# EasyEDA Pro project elisaday-high-color-value-low-cost-reflow-24a201e4.epro, board 电源板-无0402
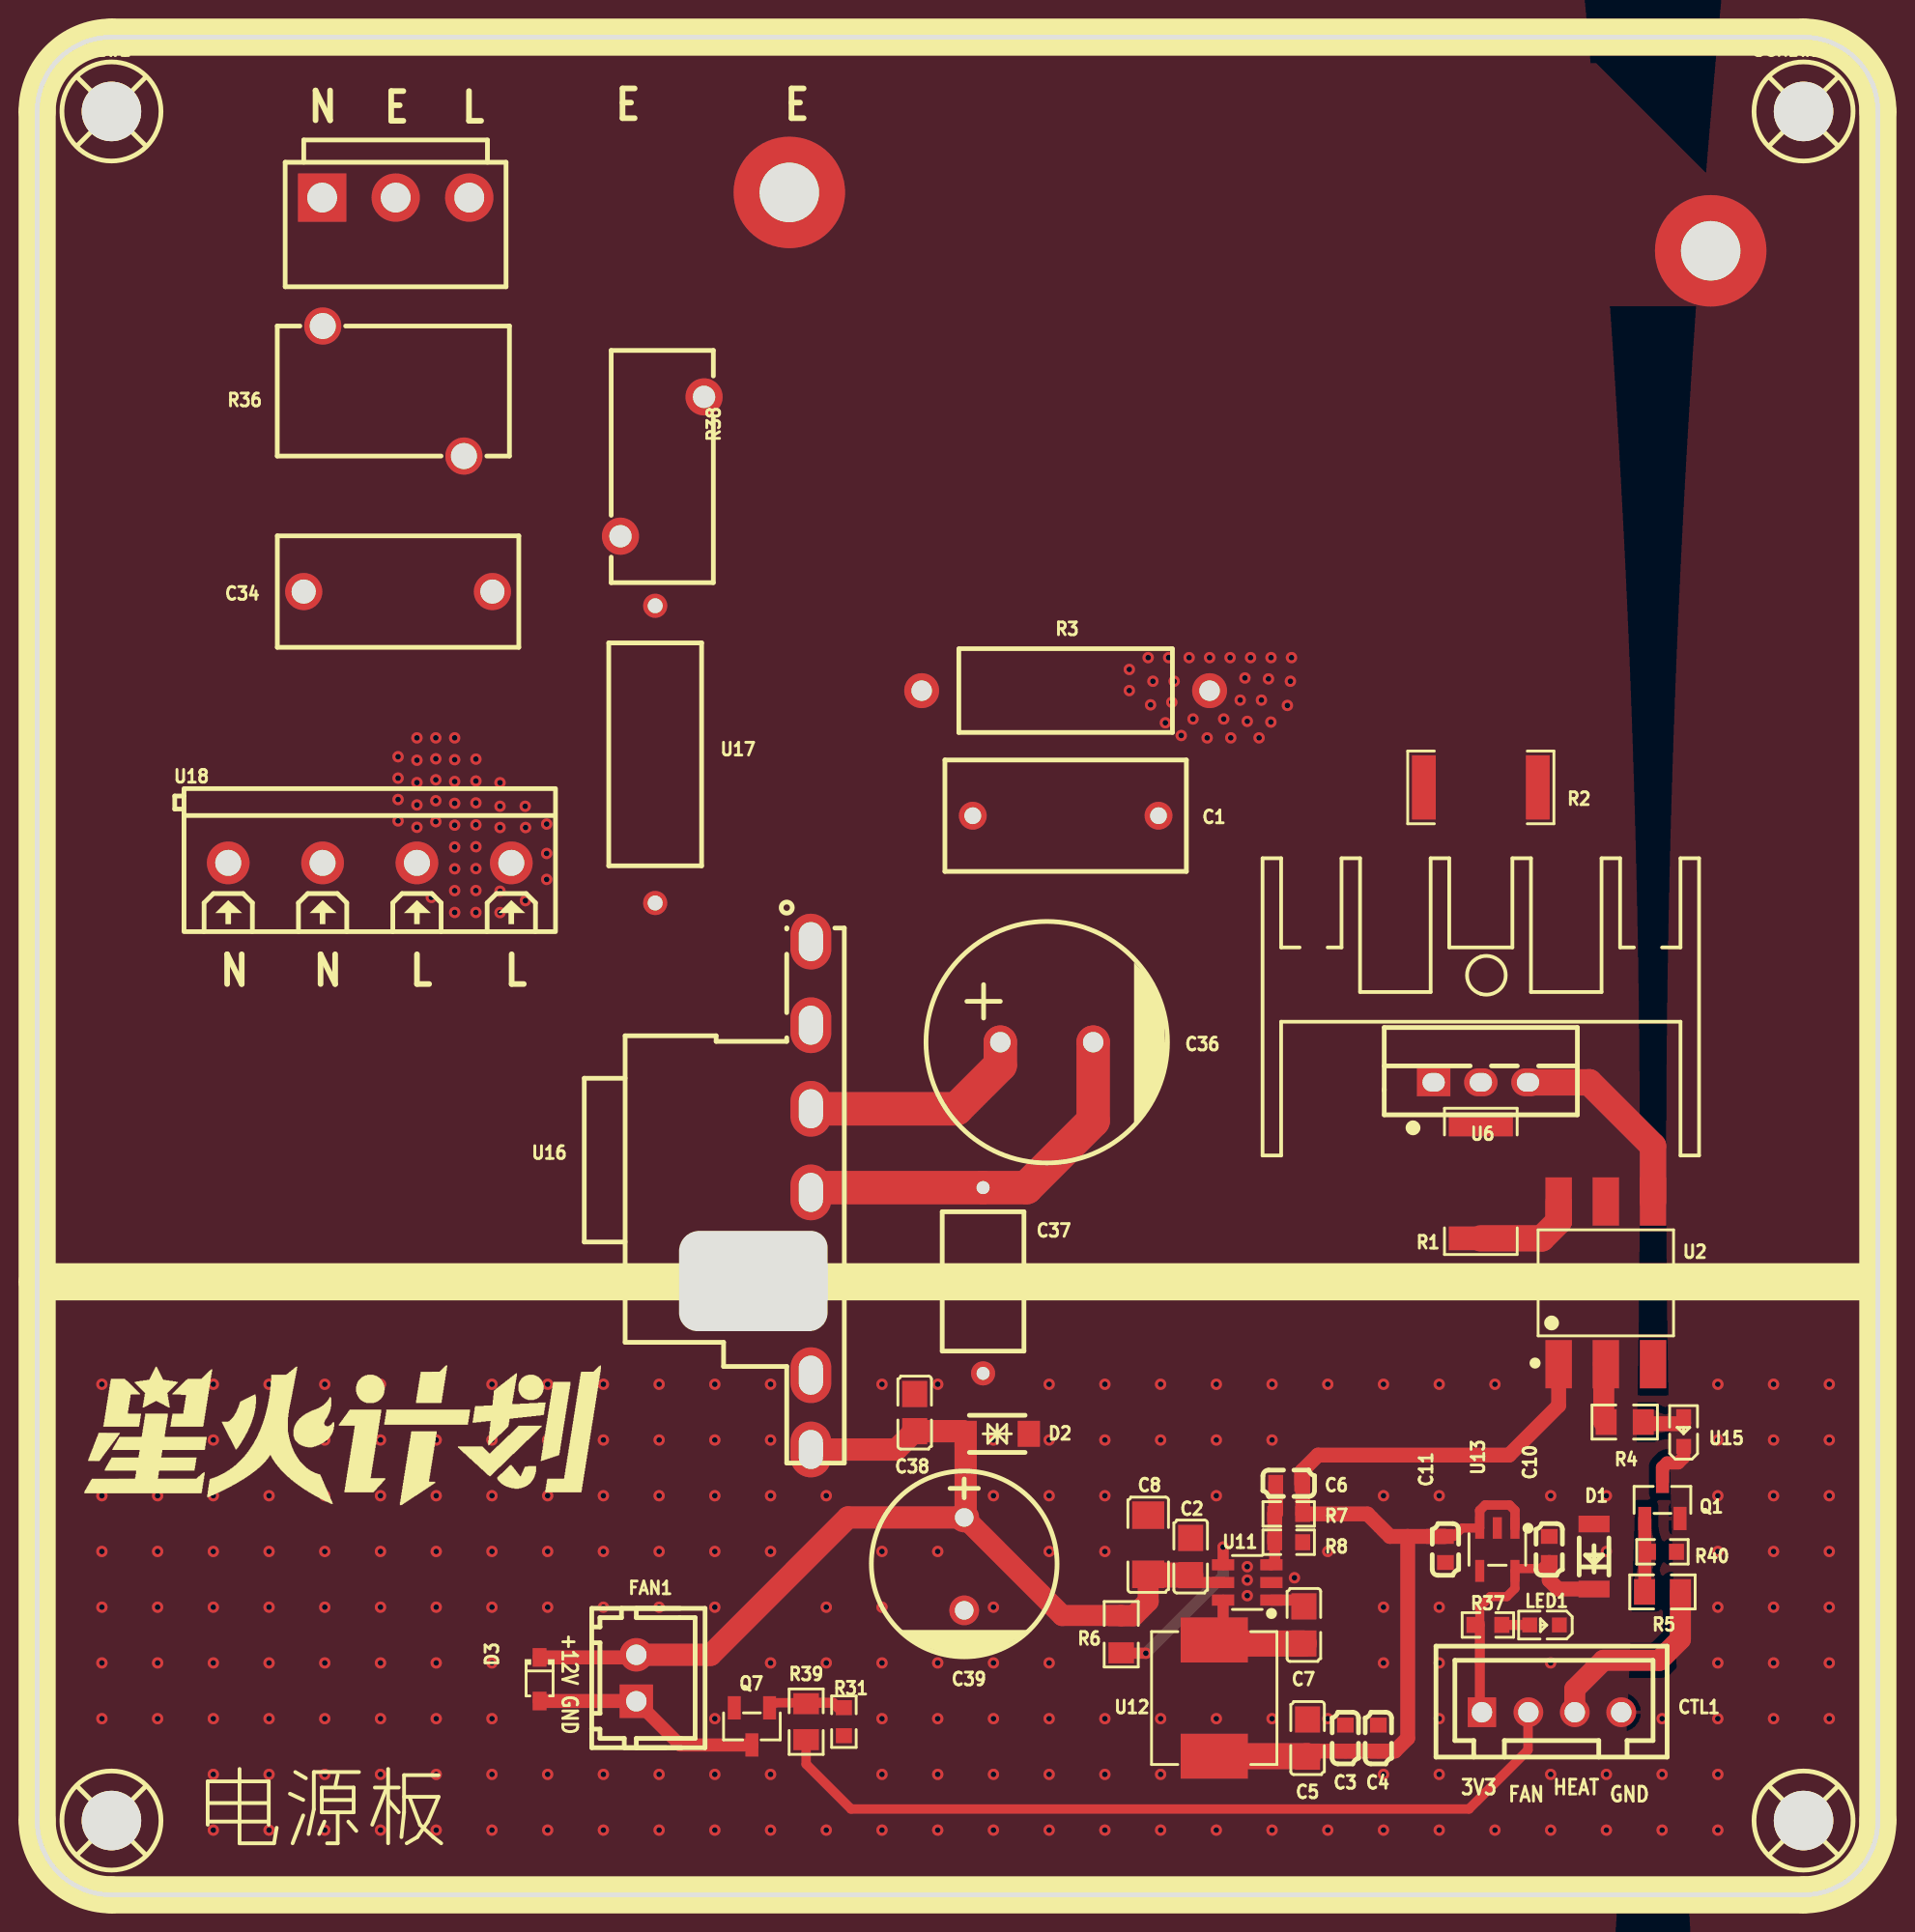
[diagram p7: board, top side]
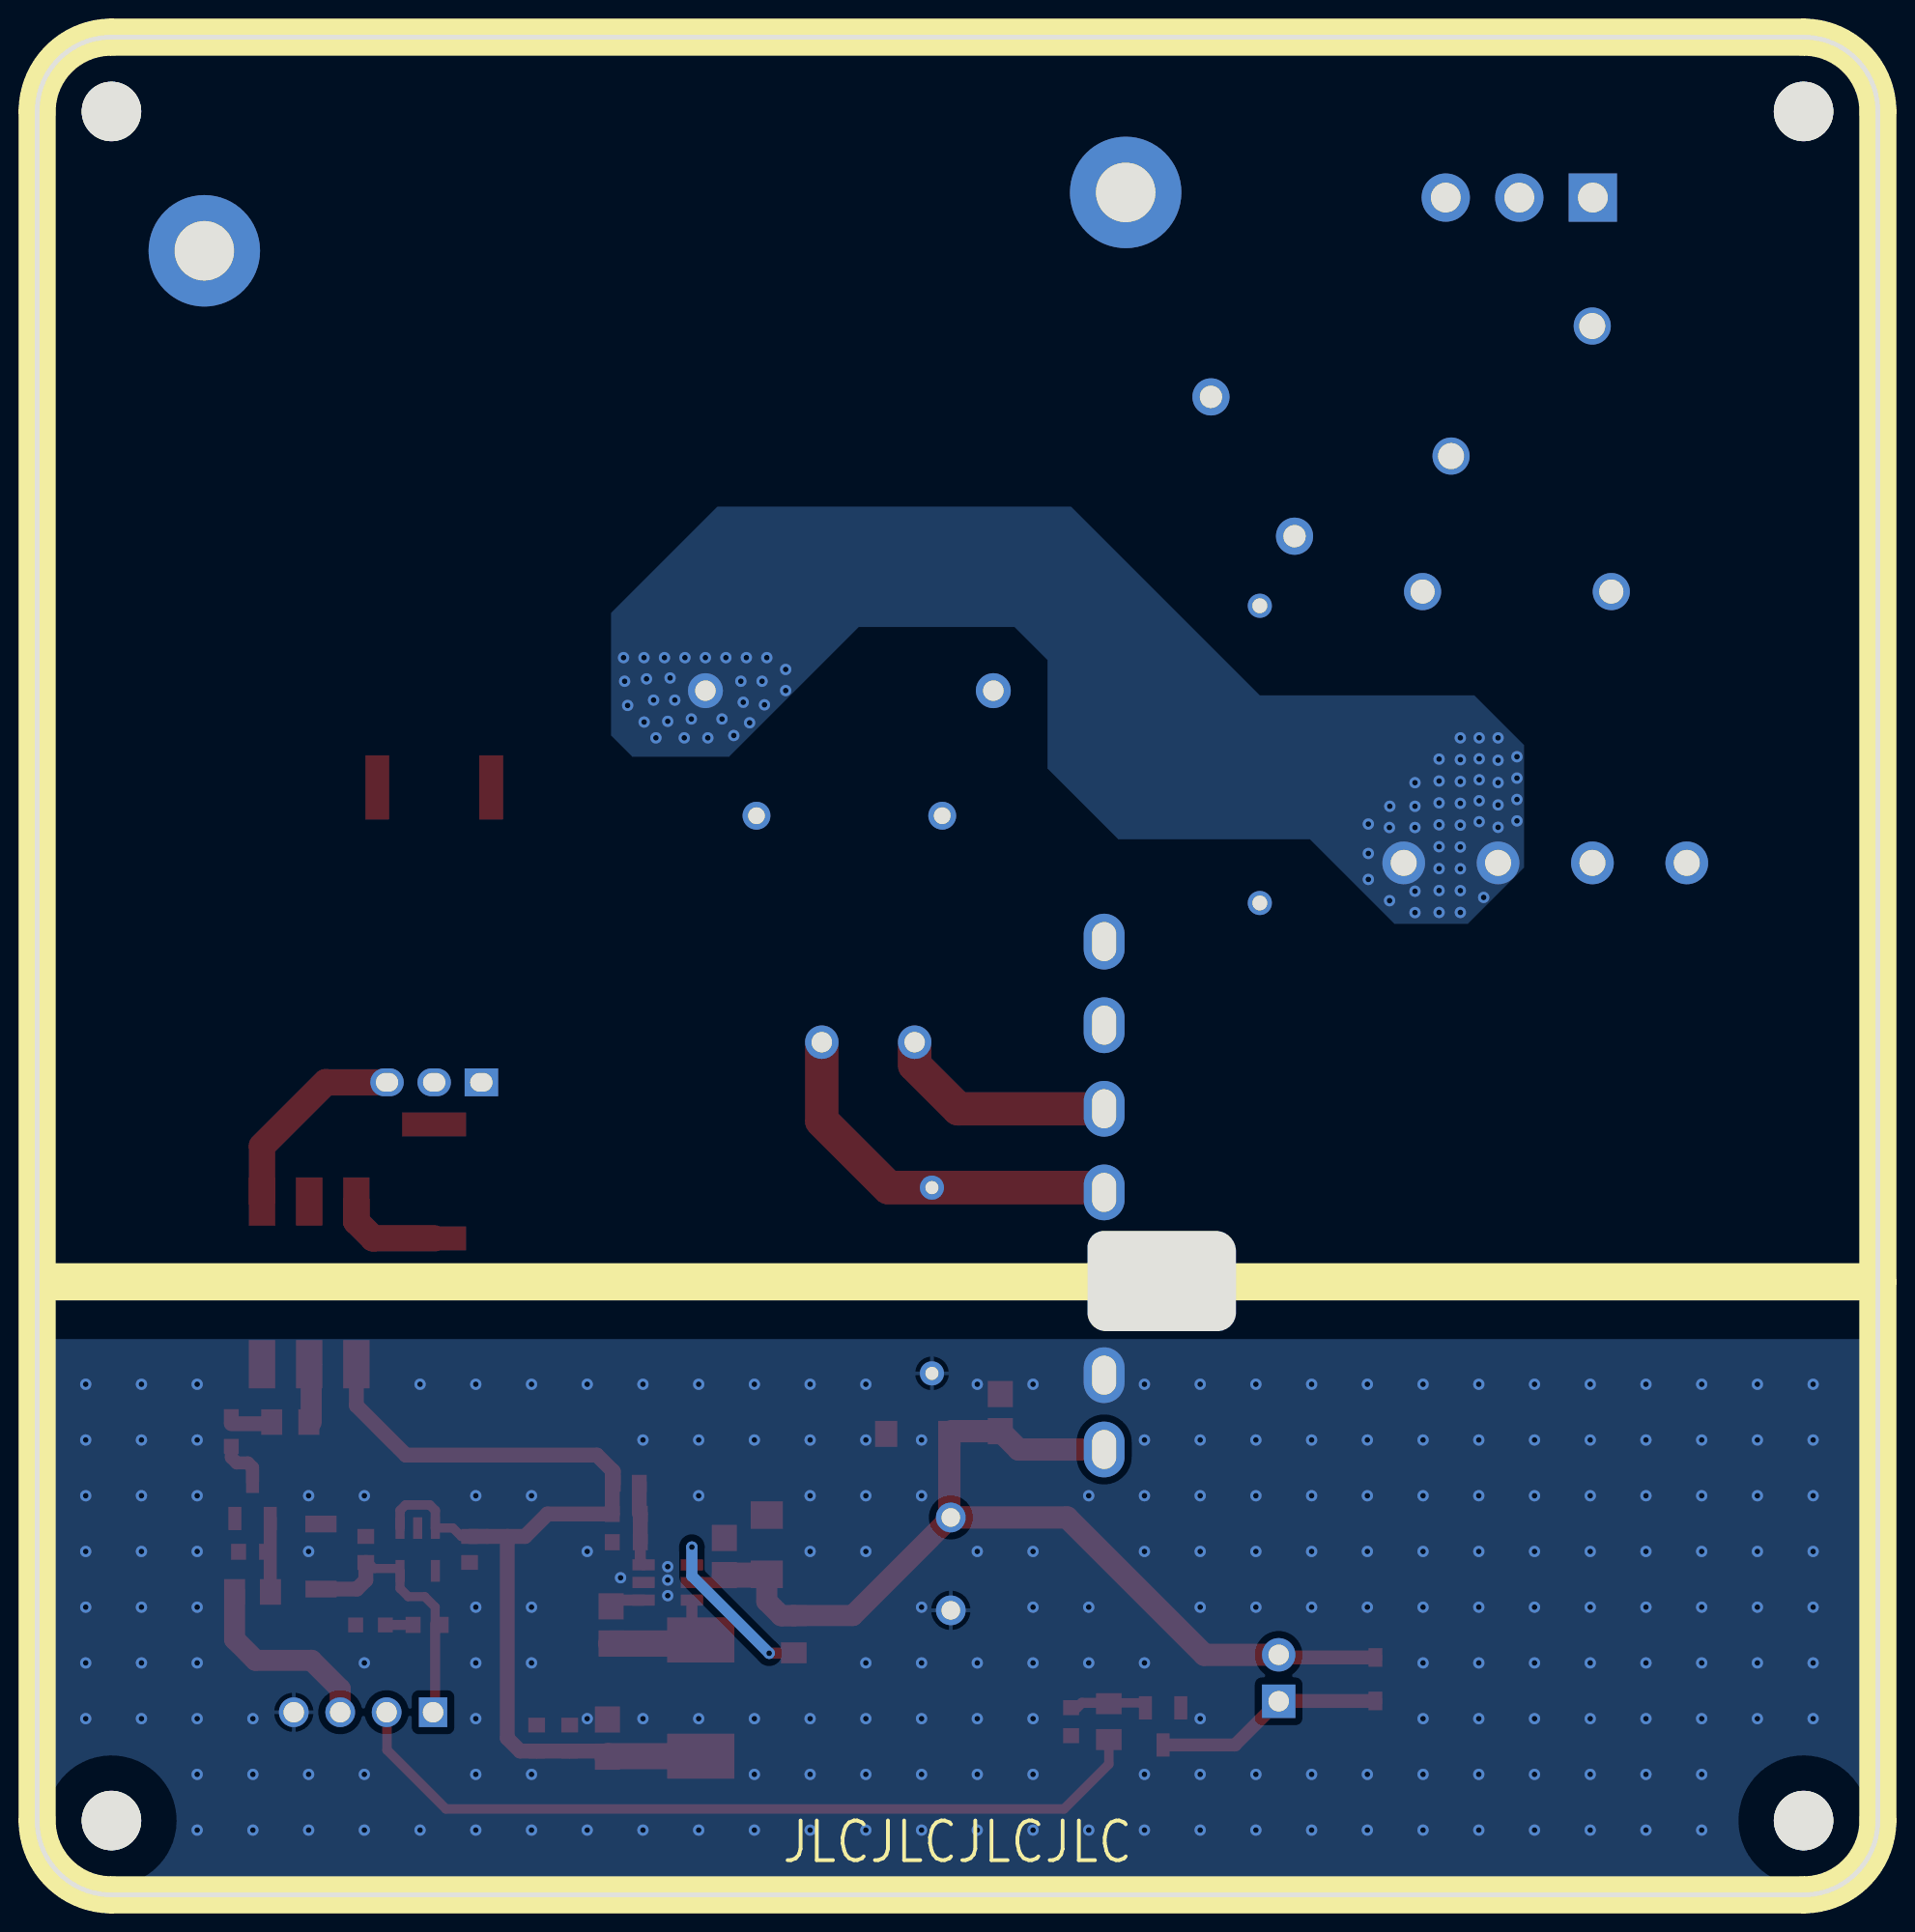
[diagram p8: board, bottom side, seen from below]

Outline 99.1 x 100 mm; copper layers: Top Layer, Bottom Layer. Coordinates in mm from the lower left corner of the outline.
Outline path: 0,96 0,4 arc(1.17,1.17) 4,0 95.1,0 arc(97.93,1.17) 99.1,4 99.1,96 arc(97.93,98.83) 95.1,100 4,100 arc(1.17,98.83) 0,96
Stack: Top Layer 0.035mm / Dielectric1 1.51mm FR4 er 4.5 / Bottom Layer 0.035mm

## Design rules (mm)
spacing copperThickness1oz (default): track to track 0.102, other pairs 0.152 to 0.3
spacing copperThickness2oz: track to track 0.203, other pairs 0.152 to 0.3
spacing Plane_innerPlane: track to track 0.102, other pairs 0.152 to 0.3
spacing Copper_copperRegion: track to track 0.102, other pairs 0.152 to 0.3
spacing Copper_dcdc: track to track 0.102, other pairs 0.152 to 0.3
spacing Copper_copperRegion15: track to track 0.102, other pairs 0.152 to 0.3
track width copperThickness1oz (default): min 0.127, default 0.254, max 4
track width copperThickness2oz: min 0.203, default 0.254, max 2.54
differential pair differentialPair (default): width min 0.127, default 0.254, max 2.54; gap min 0.152, default 0.152
net GND uses copperRegion15
pour e461 uses Copper_copperRegion15
pour e503 uses Copper_copperRegion15

## Placement (name value [footprint] x y rotation side)
C1  10nF  [CAP-TH_L13.0-W6.0-P10.00-D1.2]  55.37 58.09 180 top
C2  100nF  [C0805]  62.1 18.21 270 top
C3  22uF  [C0603]  70.43 8.44 270 top
C4  22uF  [C0603]  72.21 8.44 270 top
C5  100nF  [C0805]  68.4 8.44 90 top
C6  22pF  [C0603]  67.38 22.16 0 top
C7  100nF  [C0805]  68.2 14.53 90 top
C8  22uF  [C1206]  59.82 18.85 90 top
C10  1uF  [C0603]  81.41 18.59 270 top
C11  1uF  [C0603]  75.82 18.59 90 top
C34  100nF  [CAP-TH_L13.0-W6.0-P10.00-D1.0]  19.43 70.16 180 top
C36  22uF  [CAP-TH_BD13.0-P5.00-D0.6-FD]  54.36 45.9 0 top
C37  1nF  [CAP-TH_L7.5-W4.5-P10.00-D0.6]  50.93 33.07 90 top
C38  100nF  [C0805]  47.24 25.96 270 top
C39  1000uF  [CAP-TH_BD10.0-P5.00-D0.6-FD]  49.91 17.81 270 top
CN8  VH3.96-3P ZZ MS  [CONN-TH_3P-P3.96_MEGASTAR_ZX-VH3.96-3PZZ]  19.3 91.36 0 top
CTL1  ZX-XH2.54-4PZZ  [CONN-TH_4P-P2.50_4PIN]  81.53 9.83 0 top
D1  ZMM3V3  [LL-34_L3.5-W1.5-LS3.5-FD]  83.82 18.21 270 top
D2  SMF13CA  [SOD-123FL_L2.8-W1.8-LS3.7-BI]  51.69 24.82 180 top
D3  B5819WS  [SOD-323_L1.8-W1.3-LS2.5-RD]  27.05 11.61 270 top
FAN1  ZX-XH2.54-2PZZ  [CONN-TH_2P-P2.50_HX25003-2A]  32.26 11.67 90 top
LED1  SZYY0603R1  [LED0603-RD]  81.15 14.53 180 top
NOREF  -  [Pad_e289]  90.1 88.5 0 top
NOREF#2  -  [Pad_e290]  40.5 91.64 0 top
Q1  SI2302A  [SOT-23-3_L2.9-W1.3-P1.90-LS2.4-BR]  87.5 21.26 270 top
Q7  SI2302A  [SOT-23-3_L2.9-W1.3-P1.90-LS2.4-BR]  38.48 9.07 90 top
R1  360Ω  [R2512]  77.72 38.41 90 top
R2  360Ω  [R2512]  77.72 59.61 180 top
R3  39Ω  [RES-TH_BD4.5-L11.5-P15.50-D0.7]  55.37 64.82 180 top
R4  100Ω  [R0805]  85.47 25.45 180 top
R5  10Ω  [R0805_NEW]  87.5 16.31 180 top
R6  100kΩ  [R0805]  58.36 14.03 270 top
R7  110kΩ  [R0603]  67.38 20.5 0 top
R8  15kΩ  [R0603]  67.38 18.98 180 top
R31  15kΩ  [R0603]  43.43 9.32 90 top
R36  10D561K  [RES-TH_L12.5-W7.0-P7.50-D1.2-S7.00]  19.18 80.95 0 top
R37  3kΩ  [R0603]  78.1 14.53 180 top
R38  NTC10D-11  [RES-TH_L12.5-W5.5-P7.50-D0.8-S5.50]  33.66 76.89 90 top
R39  10Ω  [R0805_NEW]  41.4 9.32 90 top
R40  15kΩ  [R0603]  87.5 18.47 0 top
SCREW1  -  [M3螺丝]  4 96 0 top
SCREW2  -  [M3螺丝]  95.1 96 0 top
SCREW3  -  [M3螺丝]  4 4 0 top
SCREW4  -  [M3螺丝]  95.1 4 0 top
U2  MOC3083-JSM  [SMD-6_L7.3-W6.5-P2.54-LS10.2-BL]  84.46 32.94 0 top
U6  BT139-800E  [TO-220-3_L10.2-W4.5-P2.54-L-1]  77.72 43.74 0 top
U11  MT2492  [SOT-23-6_L2.9-W1.6-P0.95-LS2.8-BL_3]  65.15 16.81 90 top
U12  15uH  [IND-SMD_L7.0-W6.6_FXL0630]  63.37 10.59 270 top
U13  ME6211C33M5G-N  [SOT-23-5_L3.0-W1.7-P0.95-LS2.8-BL]  78.61 18.59 180 top
U14  XSD2156-067  [HEATSINK-TH_L23.5-W16.0_XSD2156-067]  77.72 49.2 0 top
U15  SZYY0603R1  [LED0603-RD]  88.65 24.94 90 top
U16  SFA10-S12R3P  [PWRM-TH_SFA10-S12R3P]  41.66 37.64 270 top
U17  1mH  [IND-TH_BD5.0-L12.0-P16.00-D0.6]  33.27 61.39 270 top
U18  DB126V-5.0-4P-GN-P  [CONN-TH_4P-P5.00_DIBO_DB126V-5.0-4P-GN-P]  17.91 55.55 0 top

## Footprints (pads in the part's own frame, mm; a bottom-side part is the same pattern mirrored in y, then rotated)
C0603
  rect 0.8x0.9 smd: 1(-0.7,0) 2(0.7,0)
C0805
  rect 1.41x1.35 smd: 1(-1,0) 2(1,0)
C1206
  rect 1.485x1.728 smd: 1(-1.593,0) 2(1.593,0)
CAP-TH_BD10.0-P5.00-D0.6-FD
  round 1.6 hole 1: 1(-2.5,0) 2(2.5,0)
CAP-TH_BD13.0-P5.00-D0.6-FD
  round 1.8 hole 1.1: 1(-2.5,0) 2(2.5,0)
CAP-TH_L7.5-W4.5-P10.00-D0.6
  round 1.3 hole 0.7: 1(-5,0) 2(5,0)
CAP-TH_L13.0-W6.0-P10.00-D1.0
  round 2 hole 1.3: 1(-5.08,0) 2(5.08,0)
CAP-TH_L13.0-W6.0-P10.00-D1.2
  round 1.5 hole 0.9: 1(-5,0) 2(5,0)
CONN-TH_2P-P2.50_HX25003-2A
  rect 1.8x1.8 hole 1.1: 1(-1.25,0)
  round 1.8 hole 1.1: 2(1.25,0)
CONN-TH_3P-P3.96_MEGASTAR_ZX-VH3.96-3PZZ
  rect 2.6x2.6 hole 1.6: 1(-3.96,0)
  round 2.6 hole 1.6: 2(0,0) 3(3.96,0)
CONN-TH_4P-P2.50_4PIN
  rect 1.524x1.6 hole 1.1: 1(-3.75,0)
  round 1.6 hole 1.1: 2(-1.25,0) 3(1.25,0) 4(3.75,0)
CONN-TH_4P-P5.00_DIBO_DB126V-5.0-4P-GN-P
  round 2.3 hole 1.4: 1(-7.62,0) 2(-2.54,0) 3(2.54,0) 4(7.62,0)
IND-SMD_L7.0-W6.6_FXL0630
  rect 2.424x3.62 smd: 1(3.128,0) 2(-3.128,0)
IND-TH_BD5.0-L12.0-P16.00-D0.6
  round 1.3 hole 0.8: 1(-8,0) 2(8,0)
LED0603-RD
  rect 0.8x0.8 smd: 1(-0.799,0) 2(0.799,0)
LL-34_L3.5-W1.5-LS3.5-FD
  rect 0.9x1.677 smd: 1(-1.75,0)
  rect 0.9x1.676 smd: 2(1.75,0)
M3螺丝
  round 3.2 hole 3.2: 1(0,0)
Pad_e289
  round 6 hole 3.2: 1(0,0)
Pad_e290
  round 6 hole 3.2: 1(0,0)
PWRM-TH_SFA10-S12R3P
  oval 3x2.2 hole 2.1x1.3: 1(-13.67,0) 2(-9.17,0) 3(-4.67,0) 4(-0.17,0) 5(9.67,0) 6(13.67,0)
R0603
  rect 0.806x0.864 smd: 1(-0.753,0) 2(0.753,0)
R0805
  rect 1.133x1.377 smd: 1(-1,0) 2(1,0)
R0805_NEW
  rect 1.133x1.377 smd: 1(-0.966,0) 2(0.966,0)
R2512
  rect 1.282x3.456 smd: 1(-3.067,0) 2(3.067,0)
RES-TH_BD4.5-L11.5-P15.50-D0.7
  round 1.879 hole 1.1: 1(-7.75,0) 2(7.75,0)
RES-TH_L12.5-W5.5-P7.50-D0.8-S5.50
  round 2 hole 1.2: 1(-3.75,2.25) 2(3.75,-2.25)
RES-TH_L12.5-W7.0-P7.50-D1.2-S7.00
  round 2 hole 1.4: 1(3.8,-3.5) 2(-3.8,3.5)
SMD-6_L7.3-W6.5-P2.54-LS10.2-BL
  rect 1.423x2.6 smd: 1(-2.54,-4.38) 2(0,-4.38) 3(2.54,-4.38) 4(2.54,4.38) 5(0,4.38) 6(-2.54,4.38)
SOD-123FL_L2.8-W1.8-LS3.7-BI
  rect 1.2x1.4 smd: 1(-1.7,0) 2(1.7,0)
SOD-323_L1.8-W1.3-LS2.5-RD
  rect 1x0.75 smd: 1(-1.173,0) 2(1.173,0)
SOT-23-3_L2.9-W1.3-P1.90-LS2.4-BR
  rect 1.25x0.7 smd: 1(1,-0.95) 2(1,0.95) 3(-1,0)
SOT-23-5_L3.0-W1.7-P0.95-LS2.8-BL
  rect 0.49x1.157 smd: 1(-0.95,-1.153) 2(0,-1.153) 3(0.95,-1.153)
  rect 0.49x1.175 smd: 4(0.95,1.153) 5(-0.95,1.153)
SOT-23-6_L2.9-W1.6-P0.95-LS2.8-BL_3
  rect 0.6x1.2 smd: 1(-0.95,-1.3) 2(0,-1.3) 3(0.95,-1.3) 4(0.95,1.3) 5(0,1.3) 6(-0.95,1.3)
TO-220-3_L10.2-W4.5-P2.54-L-1
  rect 1.8x1.5 hole 1.2x1: 1(-2.54,0)
  oval 1.8x1.5 hole 1.2x1: 2(0,0) 3(2.54,0)

## Nets
As in the schematic, except:
E: CN8.2 NOREF.1 NOREF#2.1

Pads without a net: SCREW1 1; SCREW2 1; SCREW3 1; SCREW4 1; U2 3 5; U13 4

## Via types
v1: diameter 0.61, hole 0.305, Top Layer to Bottom Layer, 288 vias

## Routing (per net, layer and track width the routed paths; a pad name or vN(x,y) marks a point on that pad's centre or on a via; arc(x,y) is an arc through that point)
+3.3V: length 14.6
  Top Layer w0.49: 77.67,14.53 77.67,14.66 77.67,14.66 77.67,15.49 78.23,16.05 79.12,16.05 79.56,16.5 U13.5 79.69,17.57 80.95,17.57 81.28,17.89 C10.2
  Top Layer w0.541: 77.67,14.53 77.67,9.94 CTL1.1
  Top Layer w0.8: C10.2 81.41,16.94 81.89,16.46 D1.2
+5V: length 57.4
  Top Layer w0.49: C11.2 76.26,19.29 76.72,19.75 U13.3
  Top Layer w0.508: U13.1 79.56,20.69 79.27,20.99 77.96,20.99 77.66,20.69 U13.3
  Top Layer w0.8: 73.79,19.29 73.79,8.43 73.09,7.74 C4.2 C3.2 68.7,7.74 C5.1 ; 73.79,19.29 74.87,19.29 ; 73.79,19.29 72.83,19.29 71.62,20.5 R7.2 68.13,22.85 ; 74.87,19.29 75.82,19.29 ; 74.87,19.29 C11.2 ; 68.13,22.85 68.08,22.79 C6.2 ; 68.13,22.85 68.96,23.67 79.25,23.67 81.91,26.34 U2.1
  Top Layer w1.409: U12.1 68.37,7.46 C5.1
+12V: length 57.4
  Top Layer w0.6: C2.2 62.5,16.81 U11.5
  Top Layer w0.75: D3.1 32.12,12.78 FAN1.2
  Top Layer w1.133: C39.1 55.19,15.04 58.35,15.04 R6.1 59.05,15.03 59.82,15.8 C8.1
  Top Layer w1.199: U16.6 46.26,23.97 C38.2 49.85,24.96 D2.2 49.99,20.39 C39.1 43.65,20.31 36.26,12.92 FAN1.2
  Top Layer w1.35: C8.1 59.86,17.21 C2.2
GND:
  vias: v1(3.48,27.49) v1(3.48,24.49) v1(3.48,21.49) v1(3.48,18.49) v1(3.48,15.49) v1(3.48,12.49) v1(3.48,9.49) v1(6.48,27.49) v1(6.48,24.49) v1(6.48,21.49) v1(6.48,18.49) v1(6.48,15.49) v1(6.48,12.49) v1(6.48,9.49) v1(9.48,27.49) v1(9.48,24.49) v1(9.48,21.49) v1(9.48,18.49) v1(9.48,15.49) v1(9.48,12.49) v1(9.48,9.49) v1(9.48,6.49) v1(9.48,3.49) v1(12.48,27.49) v1(12.48,24.49) v1(12.48,21.49) v1(12.48,18.49) v1(12.48,15.49) v1(12.48,12.49) v1(12.48,9.49) v1(12.48,6.49) v1(12.48,3.49) v1(15.48,27.49) v1(15.48,24.49) v1(15.48,21.49) v1(15.48,18.49) v1(15.48,15.49) v1(15.48,12.49) v1(15.48,9.49) v1(15.48,6.49) v1(15.48,3.49) v1(18.48,27.49) v1(18.48,24.49) v1(18.48,21.49) v1(18.48,18.49) v1(18.48,15.49) v1(18.48,12.49) v1(18.48,9.49) v1(18.48,6.49) v1(18.48,3.49) v1(21.48,27.49) v1(21.48,24.49) v1(21.48,21.49) v1(21.48,18.49) v1(21.48,15.49) v1(21.48,12.49) v1(21.48,9.49) v1(21.48,6.49) v1(21.48,3.49) v1(24.48,27.49) v1(24.48,24.49) v1(24.48,21.49) v1(24.48,18.49) v1(24.48,15.49) v1(24.48,12.49) v1(24.48,9.49) v1(24.48,6.49) v1(24.48,3.49) v1(27.48,27.49) v1(27.48,24.49) v1(27.48,21.49) v1(27.48,18.49) v1(27.48,15.49) v1(27.48,6.49) v1(27.48,3.49) v1(30.49,27.49) v1(30.49,24.49) v1(30.49,21.49) v1(30.49,18.49) v1(30.49,15.49) v1(30.49,6.49) v1(30.49,3.49) v1(33.49,27.49) v1(33.49,24.49) v1(33.49,21.49) v1(33.49,18.49) v1(33.49,15.49) v1(33.49,6.49) v1(33.49,3.49) v1(36.49,27.49) v1(36.49,24.49) v1(36.49,21.49) v1(36.49,18.49) v1(36.49,15.49) v1(36.49,9.49) v1(36.49,6.49) v1(36.49,3.49) v1(39.49,27.49) v1(39.49,24.49) v1(39.49,21.49) v1(39.49,18.49) v1(39.49,12.49) v1(39.49,6.49) v1(39.49,3.49) v1(42.49,21.49) v1(42.49,15.49) v1(42.49,12.49) v1(42.49,3.49) v1(45.49,27.49) v1(45.49,18.49) v1(45.49,15.49) v1(45.49,12.49) v1(45.49,9.49) v1(45.49,6.49) v1(45.49,3.49) v1(48.49,27.49) v1(48.49,18.49) v1(48.49,12.49) v1(48.49,9.49) v1(48.49,6.49) v1(48.49,3.49) v1(51.49,24.49) v1(51.49,21.49) v1(51.49,15.49) v1(51.49,12.49) v1(51.49,9.49) v1(51.49,6.49) v1(51.49,3.49) v1(54.49,27.49) v1(54.49,24.49) v1(54.49,21.49) v1(54.49,18.49) v1(54.49,12.49) v1(54.49,9.49) v1(54.49,6.49) v1(54.49,3.49) v1(57.49,27.49) v1(57.49,24.49) v1(57.49,21.49) v1(57.49,18.49) v1(57.49,9.49) v1(57.49,6.49) v1(57.49,3.49) v1(60.49,27.49) v1(60.49,24.49) v1(60.49,9.49) v1(60.49,6.49) v1(60.49,3.49) v1(63.49,27.49) v1(63.49,24.49) v1(63.49,21.49) v1(63.49,9.49) v1(63.49,3.49) v1(65.15,17.67) v1(65.15,16.94) v1(65.15,16.11) v1(66.49,27.49) v1(66.49,24.49) v1(66.49,9.49) v1(66.49,3.49) v1(67.69,17.07) v1(69.49,27.49) v1(69.49,18.49) v1(69.49,9.49) v1(69.49,3.49) v1(72.49,27.49) v1(72.49,21.49) v1(72.49,15.49) v1(72.49,12.49) v1(72.49,6.49) v1(72.49,3.49) v1(75.49,27.49) v1(75.49,21.49) v1(75.49,15.49) v1(75.49,12.49) v1(75.49,9.49) v1(75.49,6.49) v1(75.49,3.49) v1(78.49,27.49) v1(78.49,3.49) v1(81.49,21.49) v1(81.49,12.49) v1(81.49,6.49) v1(81.49,3.49) v1(84.49,21.49) v1(84.49,18.49) v1(84.49,6.49) v1(84.49,3.49) v1(87.49,9.49) v1(87.49,6.49) v1(87.49,3.49) v1(90.49,27.49) v1(90.49,24.49) v1(90.49,21.49) v1(90.49,18.49) v1(90.49,15.49) v1(90.49,12.49) v1(90.49,9.49) v1(90.49,6.49) v1(90.49,3.49) v1(93.49,27.49) v1(93.49,24.49) v1(93.49,21.49) v1(93.49,18.49) v1(93.49,15.49) v1(93.49,12.49) v1(93.49,9.49) v1(96.49,27.49) v1(96.49,24.49) v1(96.49,21.49) v1(96.49,18.49) v1(96.49,15.49) v1(96.49,12.49) v1(96.49,9.49)
+V: length 12.4
  Top Layer w1.8: C36.1 51.86,44.67 49.5,42.31 U16.3
-V: length 21
  Top Layer w1.8: C36.2 56.86,41.67 53.26,38.07 C37.2 41.91,38.07 U16.4
FAN: length 44.5
  Top Layer w0.508: R39.1 41.4,7.04 43.81,4.62 77.09,4.62 80.26,7.8 80.26,9.81 CTL1.2
HEAT_PWM: length 10.6
  Top Layer w1.133: R5.1 88.47,13.76 87.34,12.62 84.33,12.62 82.78,11.08 CTL1.3
$1N668: length 11.1
  Top Layer w1.422: U6.3 83.57,43.74 87,40.31 U2.4
$1N1007: length 5.6
  Top Layer w1.422: U2.6 81.91,36.25 81.01,35.34 R1.1
$1N1356: length 3.1
  Top Layer w1.133: 84.34,25.45 84.34,28.55 84.33,28.56
$1N1954: length 4
  Top Layer w0.701: Q1.1 86.55,16.32 R5.2
$1N3373: length 9.7
  Top Layer w0.6: R6.2 58.39,13 v1(59.69,13) ; U11.4 v1(63.85,18.72)
  Bottom Layer w0.6: v1(59.69,13) 63.85,17.17 v1(63.85,18.72)
$1N3374: length 1.9
  Top Layer w0.6: U11.1 67.86,15.87 C7.2
$1N3375: length 7.2
  Top Layer w0.6: U11.6 63.85,14.2 U12.2
  Top Layer w1.409: U12.2 63.56,13.53 C7.1
$1N3378: length 4.5
  Top Layer w0.6: U11.3 66.63,17.94 R8.2
  Top Layer w0.8: R8.2 R7.1 66.68,20.56 C6.1
$1N10591: length 1.5
  Top Layer w0.541: R37.1 LED1.2
$1N15927: length 12.4
  Top Layer w0.7: FAN1.1 34.61,8.07 Q7.3
  Top Layer w0.75: 32.24,10.44 D3.2
$1N15933: length 4.2
  Top Layer w0.508: 41.66,10.32 41.64,10.34 39.7,10.34 39.43,10.07
  Top Layer w0.541: R31.2 43.11,10.08 42.85,10.34 41.67,10.34 41.66,10.32
$1N17690: length 2.7
  Top Layer w0.701: U15.1 88.65,23.55 88.35,23.25 87.75,23.25 87.5,23 Q1.3
$1N17693: length 2.2
  Top Layer w0.8: 88.65,25.36 86.56,25.36 R4.1
$1N31397:
  vias: v1(19.43,61.27) v1(19.43,60.11) v1(19.43,58.96) v1(19.43,57.81) v1(20.45,62.28) v1(20.45,61.08) v1(20.45,59.87) v1(20.45,58.67) v1(20.45,57.47) v1(21.22,53.69) v1(21.46,62.28) v1(21.46,61.15) v1(21.46,60.02) v1(21.46,58.9) v1(21.46,57.77) v1(22.48,62.28) v1(22.48,61.11) v1(22.48,59.93) v1(22.48,58.76) v1(22.48,57.58) v1(22.48,56.41) v1(22.48,55.23) v1(22.48,54.06) v1(22.48,52.88) v1(23.62,61.14) v1(23.62,59.96) v1(23.62,58.78) v1(23.62,57.6) v1(23.62,56.42) v1(23.62,55.24) v1(23.62,54.06) v1(23.62,52.88) v1(24.92,59.87) v1(24.92,58.6) v1(24.92,57.45) v1(24.92,54.03) v1(24.92,52.88) v1(26.28,58.6) v1(26.3,57.45) v1(26.29,53.52) v1(27.43,57.64) v1(27.43,56.06) v1(27.43,54.66) v1(58.8,65.96) v1(58.8,64.83) v1(59.82,66.6) v1(59.94,64.06) v1(60.07,65.33) v1(60.74,63.09) v1(60.92,66.6) v1(61.09,64.2) v1(61.21,65.33) v1(61.59,62.41) v1(62.02,66.6) v1(62.23,63.3) v1(62.99,62.28) v1(63.12,66.6) v1(63.88,63.3) v1(64.22,66.6) v1(64.26,62.28) v1(64.77,64.31) v1(65.02,65.5) v1(65.15,63.17) v1(65.33,66.6) v1(65.79,62.28) v1(65.91,64.31) v1(66.29,65.46) v1(66.43,66.6) v1(66.42,63.13) v1(67.31,64.03) v1(67.53,66.6) v1(67.47,65.33)

## Copper pours and planes (outline as drawn; the poured copper is in the pictures)
GND on Top Layer: -3.17,32.82 103.25,32.82 103.25,-3.89 -3.17,-3.89
GND on Bottom Layer: -4.83,32.82 105.28,32.82 105.28,-5.92 -4.83,-5.92
E on Top Layer: 18.03,98.6 92.58,98.6 92.58,85.52 18.03,85.52
L on Top Layer: 23.5,71.17 42.8,71.17 42.8,49.83 23.5,49.83
L_IN on Top Layer: 22.05,92.63 79.41,92.63 79.41,39.81 22.05,39.81
N on Top Layer: 8.51,92.63 42.54,92.63 42.54,45.26 8.51,45.26
$1N668 on Top Layer: 79.37,61.29 83.94,61.29 83.94,43.74 79.37,43.74
$1N1123 on Top Layer: 46.86,65.96 61.09,65.96 61.09,57.07 46.86,57.07
$1N20003 on Top Layer: 21.97,78.54 34.04,78.54 34.04,68.76 21.97,68.76
$1N31397 on Top Layer: 58.29,67.36 75.31,67.36 75.31,57.84 58.29,57.84
$1N31397 on Top Layer: 19.05,63.3 27.81,63.3 27.81,52.24 19.05,52.24
$1N31397 on Top Layer: 71.13,57.99 76.07,57.99 76.07,44.44 71.13,44.44
$1N31397 on Bottom Layer: 19.05,74.73 68.2,74.73 68.2,52.26 19.05,52.26

Small or netless copper shapes (teardrops, artwork), in the pictures only: 72 on Top Layer, 2 on Bottom Layer

## Text on the board
Bottom Silkscreen Layer: JLCJLCJLCJLC
Top Silkscreen Layer: 3V3 | FAN | HEAT | GND | +12V | N | E | L | 电源板
